# Altium schematic sheet RMS.SchDoc: AC RMS to DC Converter
size A4; ApprovedBy: LD Stanton; Author: LD Stanton; CompanyName: University of Cape Town; DrawnBy: Lawrence Stanton; Engineer: Lawrence Stanton; Organization: University of Cape Town; Address1: Department of Electrical Engineering; Address2: Rondebosch; Address3: Cape Town; Address4: South Africa 7701; DocumentNumber: 12; SheetNumber: 12; SheetTotal: 14
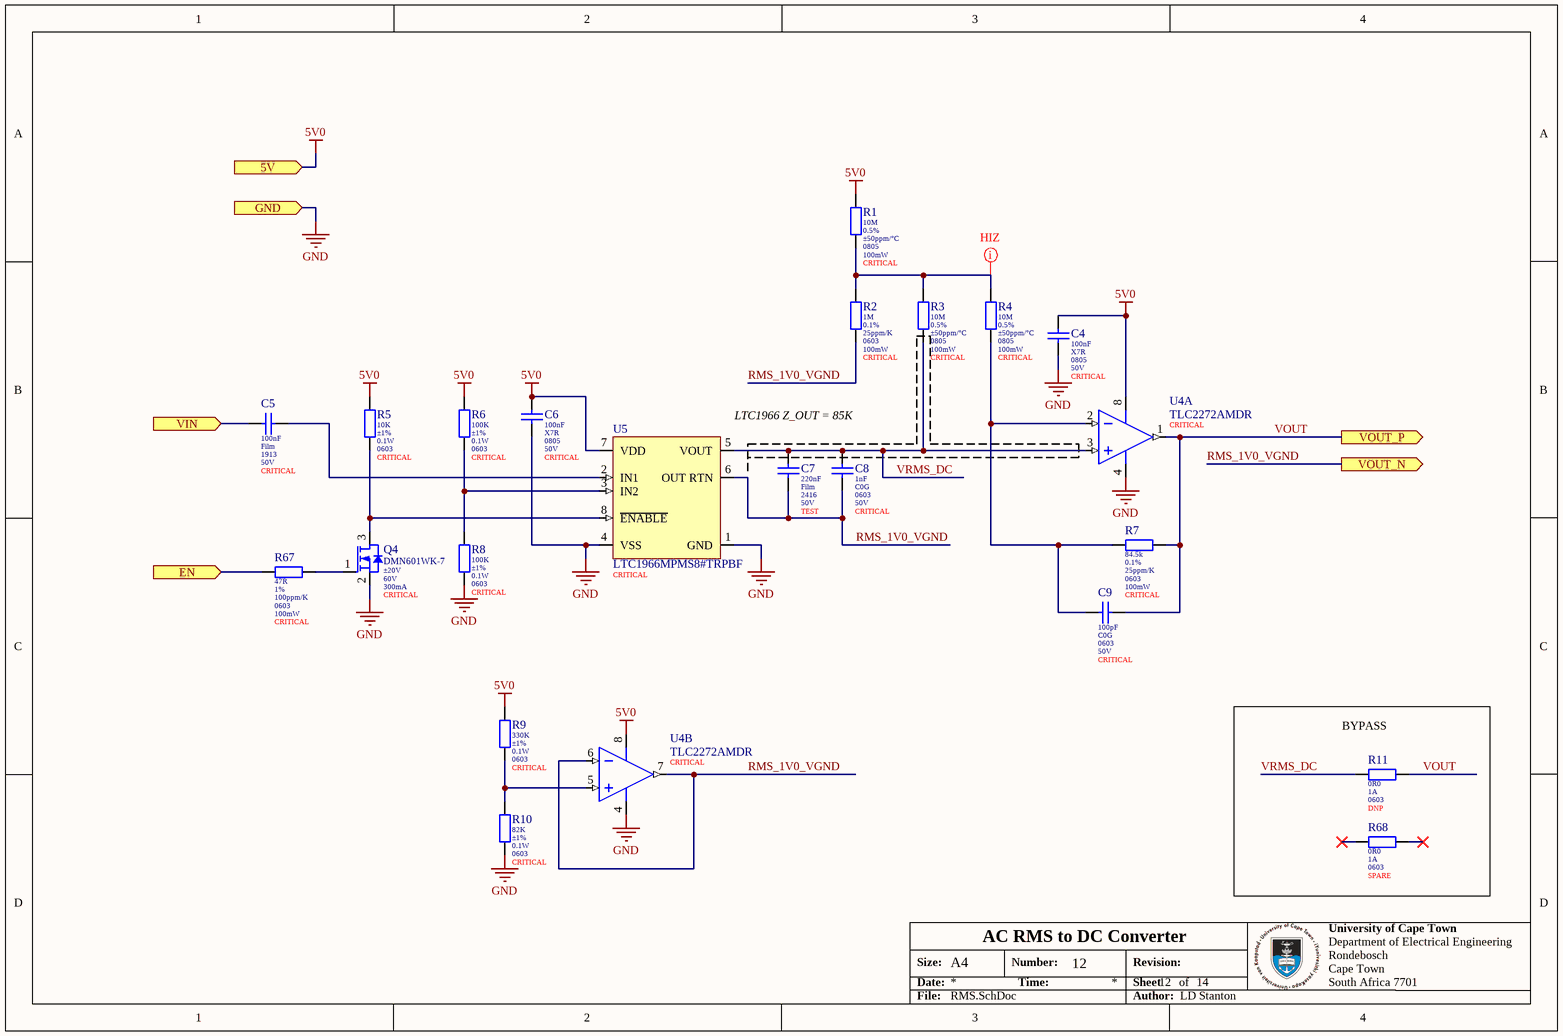
[diagram p0: RMS.SchDoc]

## Parts
C4  value 100nF  Dielectric: X7R  Package: 0805  Voltage: 50V  Populate: CRITICAL  [0805 (Yageo EA) B]  (hidden comment: CC0805KRX7R9BB104)
C5  value 100nF  Dielectric: Film  Package: 1913  Voltage: 50V  Populate: CRITICAL  [1913 (ECHU E2) B]  (hidden comment: ECHU1H104GX9)
C6  value 100nF  Dielectric: X7R  Package: 0805  Voltage: 50V  Populate: CRITICAL  [0805 (Yageo EA) B]  (hidden comment: CC0805KRX7R9BB104)
C7  value 220nF  Dielectric: Film  Package: 2416  Voltage: 50V  Populate: TEST  [2416 (Panasonic ECHU) B]  (hidden comment: ECH-U1H224GX9)
C8  value 1nF  Dielectric: C0G  Package: 0603  Voltage: 50V  Populate: CRITICAL  [0603_080_8 (Samsung) B]  (hidden comment: CL10C102JB8NNNC)
C9  value 100pF  Dielectric: C0G  Package: 0603  Voltage: 50V  Populate: CRITICAL  [0603_080_8 (Samsung) B]  (hidden comment: CL10C101JB8NNNC)
Q4  DMN601WK-7  Gate Source Voltage: ±20V  Drain Source Voltage: 60V  Continous Drain Current: 300mA  Placement: CRITICAL  [SOT323 (DMN601WK) B]
R1  value 10M  Tolerance: 0.5%  Temperature Coefficient: ±50ppm/°C  Package: 0805  Power: 100mW  Populate: CRITICAL  [0805 (Vishay DCRCW-P) A]  (hidden comment: CRCW080510M0DHEAP)
R2  value 1M  Tolerance: 0.1%  Temperature Coefficient: 25ppm/K  Package: 0603  Power: 100mW  Populate: CRITICAL  [0603 (Yageo RT) B]  (hidden comment: RT0603BRD071ML)
R3  value 10M  Tolerance: 0.5%  Temperature Coefficient: ±50ppm/°C  Package: 0805  Power: 100mW  Populate: CRITICAL  [0805 (Vishay DCRCW-P) A]  (hidden comment: CRCW080510M0DHEAP)
R4  value 10M  Tolerance: 0.5%  Temperature Coefficient: ±50ppm/°C  Package: 0805  Power: 100mW  Populate: CRITICAL  [0805 (Vishay DCRCW-P) A]  (hidden comment: CRCW080510M0DHEAP)
R5  value 10K  Tolerance: ±1%  Power: 0.1W  Package: 0603  Populate: CRITICAL  [0603 (Uniroyal) B]  (hidden comment: 0603WAF1002T5E)
R6  value 100K  Tolerance: ±1%  Power: 0.1W  Package: 0603  Populate: CRITICAL  [0603 (Uniroyal) B]  (hidden comment: 0603WAF1003T5E)
R7  value 84.5k  Tolerance: 0.1%  Temperature Coefficient: 25ppm/K  Package: 0603  Power: 100mW  Populate: CRITICAL  [0603 (Yageo RT) B]  (hidden comment: RT0603BRD0784K5L)
R8  value 100K  Tolerance: ±1%  Power: 0.1W  Package: 0603  Populate: CRITICAL  [0603 (Uniroyal) B]  (hidden comment: 0603WAF1003T5E)
R9  value 330K  Tolerance: ±1%  Power: 0.1W  Package: 0603  Populate: CRITICAL  [0603 (Uniroyal) B]  (hidden comment: 0603WAF3303T5E)
R10  value 82K  Tolerance: ±1%  Power: 0.1W  Package: 0603  Populate: CRITICAL  [0603 (Uniroyal) B]  (hidden comment: 0603WAF8202T5E)
R11  value 0R0  Current: 1A  Package: 0603  Populate: DNP  [0603 (Uniroyal) B]  (hidden comment: 0603WAF0000T5E)
R67  value 47R  Tolerance: 1%  Temperature Coefficient: 100ppm/K  Package: 0603  Power: 100mW  Populate: CRITICAL  [0603 (Uniroyal) B]  (hidden comment: 0603WAF470JT5E)
R68  value 0R0  Current: 1A  Package: 0603  Populate: SPARE  [0603 (Uniroyal) B]  (hidden comment: 0603WAF0000T5E)
U4  TLC2272AMDR  Placement: CRITICAL  [SOIC-8 (D008A) B]  (parts A,B of 2)
U5  LTC1966MPMS8#TRPBF  Placement: CRITICAL  [MSOP-8 (LTC1966) B]

## Blocks framed on the sheet
BYPASS: R11 R68

## Ports
5V (in), EN (in), GND (in), VIN (in), VOUT_N (out), VOUT_P (out)

## Nets
5V0: C4.2 C6.2 R1.1 R5.1 R6.1 R9.1 U4.8(VDD+) U5.7(VDD) ; port 5V
GND: C4.1 C6.1 Q4.2(S) R8.2 R10.2 U4.4(VDD-/GND) U5.1(GND) U5.4(VSS) ; port GND
EN: R67.1 ; port EN
RMS_1V0_VGND: C7.2 C8.2 R2.1 U4.6(IN2-) U4.7(OUT2) U5.6(OUT_RTN) ; port VOUT_N
VIN: C5.1 ; port VIN
VOUT: C9.2 R7.2 R11.2 U4.1(OUT1) ; port VOUT_P
VRMS_DC: C7.1 C8.1 R3.2 R11.1 U4.3(IN1+) U5.5(VOUT)
NetC5_2: C5.2 U5.2(IN1)
NetC9_1: C9.1 R4.2 R7.1 U4.2(IN1-)
NetQ4_1: Q4.1(G) R67.2
NetQ4_3: Q4.3(D) R5.2 U5.8(~{ENABLE})
NetR1_2: R1.2 R2.2 R3.1 R4.1
NetR6_2: R6.2 R8.1 U5.3(IN2)
NetR9_2: R9.2 R10.1 U4.5(IN2+)

Not connected (* = marked no-connect by the designer): R68 1* 2*

## Layout directives
rule Clearance Constraint [Clearance = 0.5mm]; rule Solder Mask Expansion [Expansion = 7.874mil]: NetR1_2

## Notes on the sheet
- LTC1966 Z_OUT = 85K
- Size:
- Date:
- A4
- Number:
- Time:
- Revision:
- Sheet
- of
- File:
- Author:

## Library data of the parts
C4 C6 = CMP-047-000001-7: MLCC 100nF 50V 0805 X7R ±10%; Manufacturer: Yageo; ComponentLink1Description: Datasheet; ComponentLink1URL: https://datasheet.lcsc.com/szlcsc/YAGEO-CC0603KRX7R9BB104_C14663.pdf; Tolerance: ±10%; LCSC Part Number: C49678
C5 = CMP-001-00001-1: Film Capacitor, Polyphenylene Sulfide, 50V, 2% +Tol, 2% -Tol, 0.1uF, Surface Mount, 1913; ComponentLink1Description: Datasheet; Max Operating Temperature: 125°C; Tolerance: 2%; LCSC Part Number: C569828; ComponentLink1URL: https://jlcpcb.com/api/file/downloadByFileSystemAccessId/8588893398266204160; Min Operating Temperature: -55°C
C7 = CMP-001-00007-1: Film Capacitor, Polyphenylene Sulfide, 50V, 2% +Tol, 2% -Tol, 0.22uF, Surface Mount, 2416; LCSC Part Number: C569856; Min Operating Temperature: -55°C; ComponentLink1Description: Datasheet; Max Operating Temperature: 125°C; ComponentLink1URL: https://jlcpcb.com/api/file/downloadByFileSystemAccessId/8590903044286726144; Tolerance: 2%
C8 = CMP-00124-1: MLCC 1nF 0603 50V C0G ±5%; Manufacturer: Samsung; ComponentLink1URL: https://datasheet.lcsc.com/szlcsc/Samsung-Electro-Mechanics-CL05C100JB5NNNC_C32949.pdf; LCSC Part Number: C163508; Tolerance: 5%; Min Operating Temperature: -55°C; ComponentLink1Description: Datasheet; Max Operating Temperature: 125°C
C9 = CMP-045-000015-10: MLCC 100pF 0603 50V C0G ±0.1pF; Manufacturer: Samsung; ComponentLink1URL: https://datasheet.lcsc.com/szlcsc/Samsung-Electro-Mechanics-CL05C100JB5NNNC_C32949.pdf; ComponentLink1Description: Datasheet; Tolerance: ±0.1pF; LCSC Part Number: C14858
Q4 = CMP-00131-1: Mosfet, N-Ch, 60V, 0.3A, Sot-323 Rohs Compliant: Yes; Drain Source Resistance: 2; Polarity: N-Channel; Mode: Enhancement; LCSC Part Number: C151318; ComponentLink1URL: https://jlcpcb.com/api/file/downloadByFileSystemAccessId/8586203582969860096; Min Operating Temperature: -65°C; ComponentLink1Description: Datasheet; Max Operating Temperature: 150°C
R1 R3 R4 = CMP-009-00009-1: Resistor 10M 0805 ±0.5% Thick Film Vishay; Voltage Rating: 150V; Max Operating Temperature: 155°C; LCSC Part Number: C843972; Min Operating Temperature: -55°C; ComponentLink1Description: Datasheet; Manufacturer: Vishay; ComponentLink1URL: https://jlcpcb.com/api/file/downloadByFileSystemAccessId/8589808148883681280; Composition: Thick Film
R2 = CMP-00125-2: Resistor 1M0 0603 ±0.1% Thin Film Yaego; Voltage Rating: 75V; ComponentLink1Description: Datasheet; Manufacturer: Yaego; ComponentLink1URL: https://jlcpcb.com/api/file/downloadByFileSystemAccessId/8588919467732840449; Composition: Thin Film; Max Operating Temperature: 155°C; Min Operating Temperature: -55°C; LCSC Part Number: C326730
R5 = CMP-010-000293-9: Resistor 10K 0603 ±1% Thick Film Uniroyal; Working Voltage: 75V; Temperature Coefficient: ±100ppm/K; Temperature: -55 - 155°C; ComponentLink1URL: https://datasheet.lcsc.com/szlcsc/1811062009_UNI-ROYAL-Uniroyal-Elec-0603WAF1002T5E_C25804.pdf; LCSC Part Number: C25804; ComponentLink1Description: Datasheet; Pin Count: 2; Manufacturer: Uniroyal
R6 R8 = CMP-010-000288-10: Resistor 100K 0603 ±1% Thick Film Uniroyal; Temperature Coefficient: ±100ppm/K; Working Voltage: 75V; LCSC Part Number: C25803; Temperature: -55 - 155°C; ComponentLink1URL: https://datasheet.lcsc.com/szlcsc/1811062009_UNI-ROYAL-Uniroyal-Elec-0603WAF1002T5E_C25804.pdf; Pin Count: 2; Manufacturer: Uniroyal; ComponentLink1Description: Datasheet
R7 = CMP-009-00002-1: Resistor 84K5 0603 ±0.1% Thin Film Yaego; Voltage Rating: 75V; LCSC Part Number: C705797; ComponentLink1URL: https://jlcpcb.com/api/file/downloadByFileSystemAccessId/8588919467732840449; ComponentLink1Description: Datasheet; Manufacturer: Yaego; Composition: Thin Film; Max Operating Temperature: 155°C; Min Operating Temperature: -55°C
R9 = CMP-010-000382-2: Resistor 330K 0603 ±1% Thick Film Uniroyal; Temperature Coefficient: ±100ppm/K; Working Voltage: 75V; LCSC Part Number: C23137; Manufacturer: Uniroyal; Temperature: -55 - 155°C; ComponentLink1URL: https://datasheet.lcsc.com/szlcsc/1811062009_UNI-ROYAL-Uniroyal-Elec-0603WAF1002T5E_C25804.pdf; ComponentLink1Description: Datasheet; Pin Count: 2
R10 = CMP-010-000347-9: Resistor 82K 0603 ±1% Thick Film Uniroyal; Temperature Coefficient: ±100ppm/K; Working Voltage: 75V; ComponentLink1URL: https://datasheet.lcsc.com/szlcsc/1811062009_UNI-ROYAL-Uniroyal-Elec-0603WAF1002T5E_C25804.pdf; LCSC Part Number: C23254; Pin Count: 2; Manufacturer: Uniroyal; ComponentLink1Description: Datasheet; Temperature: -55 - 155°C
R11 R68 = CMP-010-000359-7: Jumper 0603 1A Uniroyal; Pin Count: 2; ComponentLink1URL: https://datasheet.lcsc.com/szlcsc/1811062009_UNI-ROYAL-Uniroyal-Elec-0603WAF1002T5E_C25804.pdf; Manufacturer: Uniroyal; LCSC Part Number: C21189; Temperature: -55 - 155°C; ComponentLink1Description: Datasheet
R67 = CMP-00128-3: Resistor 47R 0603 ±1% Thick Film Uniroyal; Voltage Rating: 75V; ComponentLink1Description: Datasheet; Min Operating Temperature: -55°C; Manufacturer: Uniroyal; ComponentLink1URL: https://datasheet.lcsc.com/szlcsc/1811062009_UNI-ROYAL-Uniroyal-Elec-0603WAF1002T5E_C25804.pdf; Composition: Thick Film; LCSC Part Number: C23182; Max Operating Temperature: 155°C
U4 = CMP-00126-1: Operational Amplifier, 2 Func, 1500uV Offset-Max, CMOS, PDSO8; Single Supply: Yes; Output Current: 50mA; Input Bias Current: 800pA; Input Offset Voltage: 1.5mV; Supply Max: 8V; Supply Min: -8V; Rail to Rail: Yes; ComponentLink1Description: Datasheet; Input Offset Current: 800pA; LCSC Part Number: C2878284; Min Operating Temperature: -55°C; Max Operating Temperature: 125°C; ComponentLink1URL: https://www.ti.com/lit/ds/symlink/tlc2272.pdf?ts=1754033641708&ref_url=https%253A%252F%252Fwww.ti.com%252Fproduct%252FTLC2272%253Futm_source%253Dgoogle%2526utm_medium%253Dcpc%2526utm_campaign%253Dasc-amps-null-44700045336317476_prodfolderdynamic-cpc-pf-go
U5 = CMP-00123-3: RMS to DC Converter, 1 Func, CMOS, PDSO8; Min Supply Voltage: 2.7V; Max Supply Voltage: 5.5V; ComponentLink1Description: Datasheet; Min Operating Temperature: -55°C; ComponentLink1URL: https://www.analog.com/media/en/technical-documentation/data-sheets/1966fb.pdf; LCSC Part Number: C679071; Max Operating Temperature: 125°C